# Altium schematic sheet RK3568-Flash-SD-Controller.SchDoc
size 420 x 297 mm; SheetNumber: 7; SheetTotal: 25
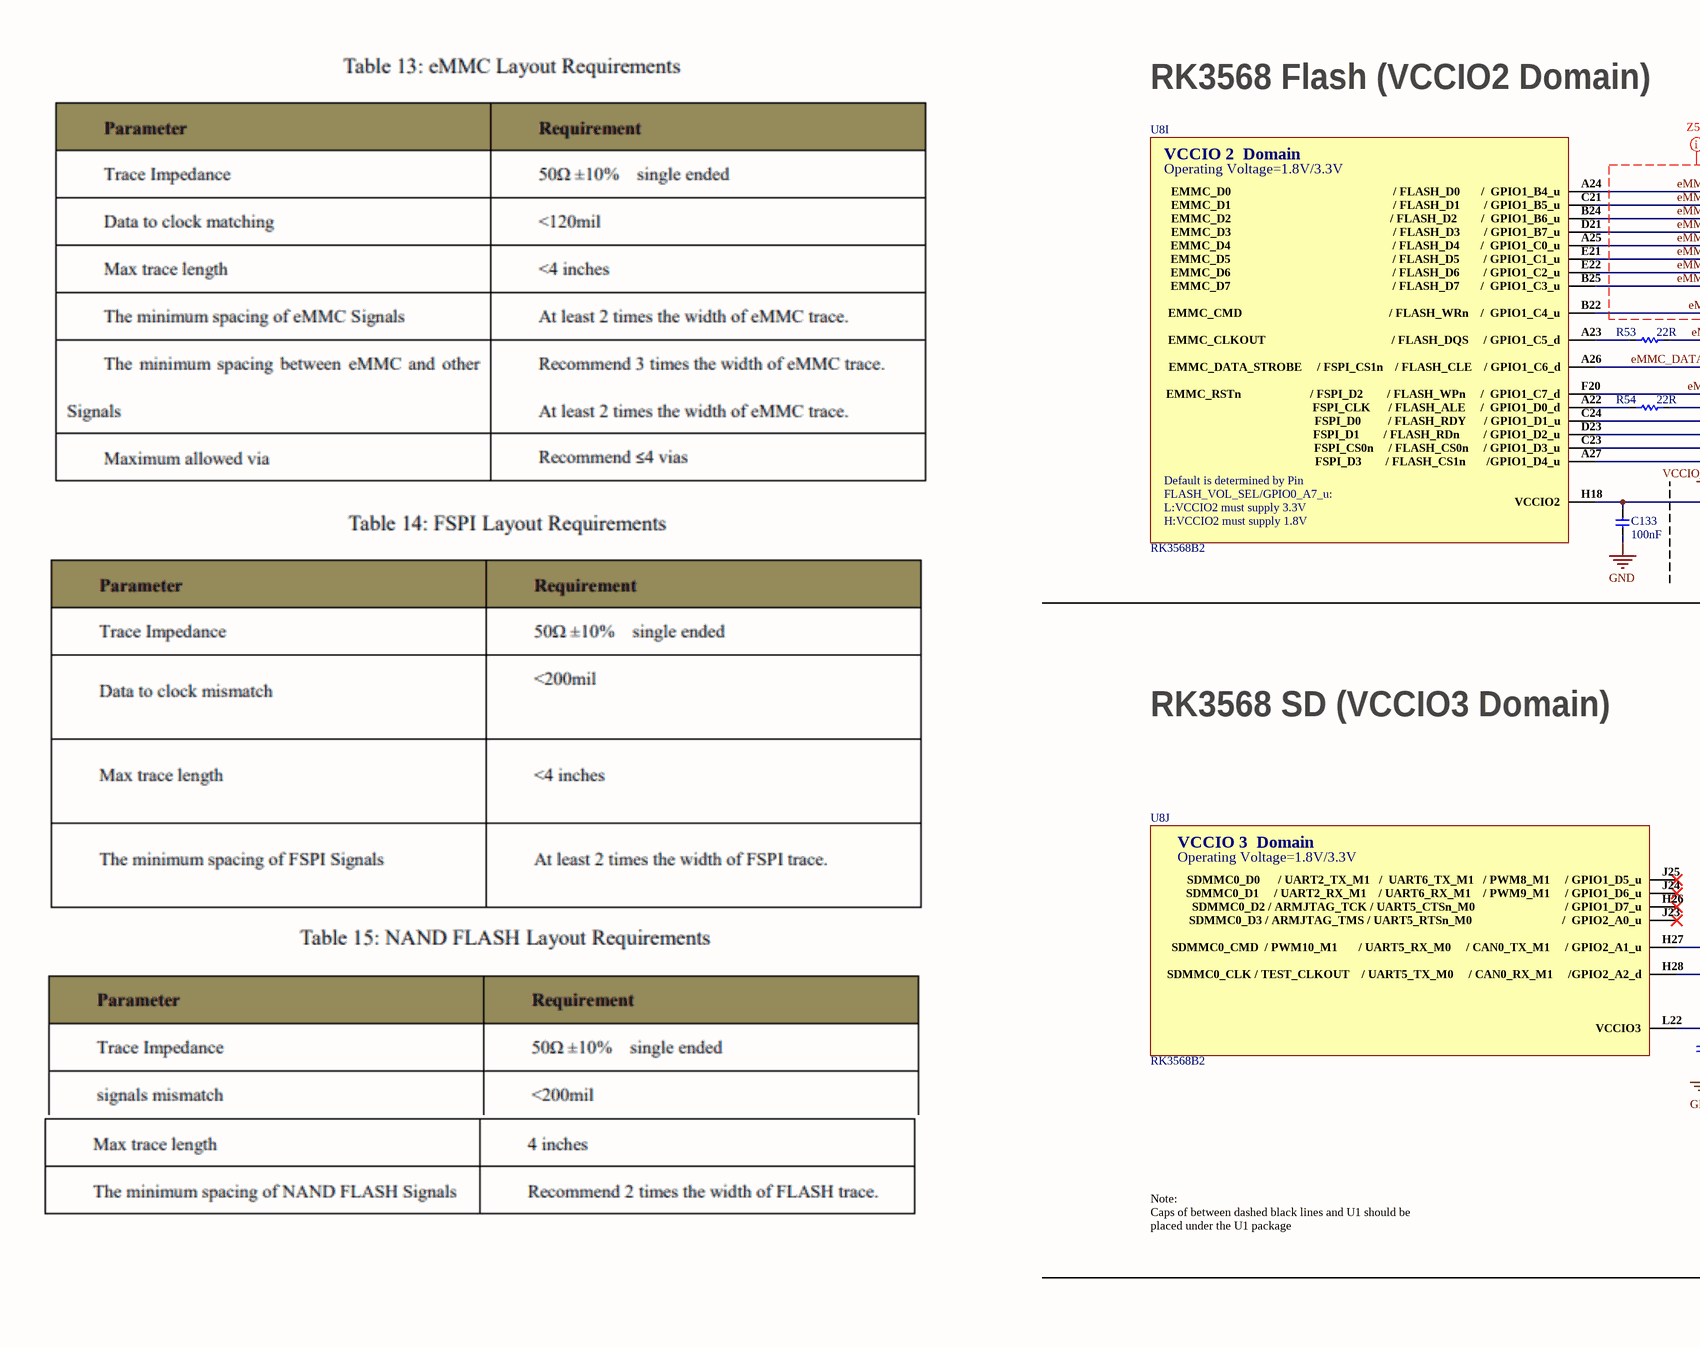
[diagram p0: RK3568-Flash-SD-Controller.SchDoc, left]
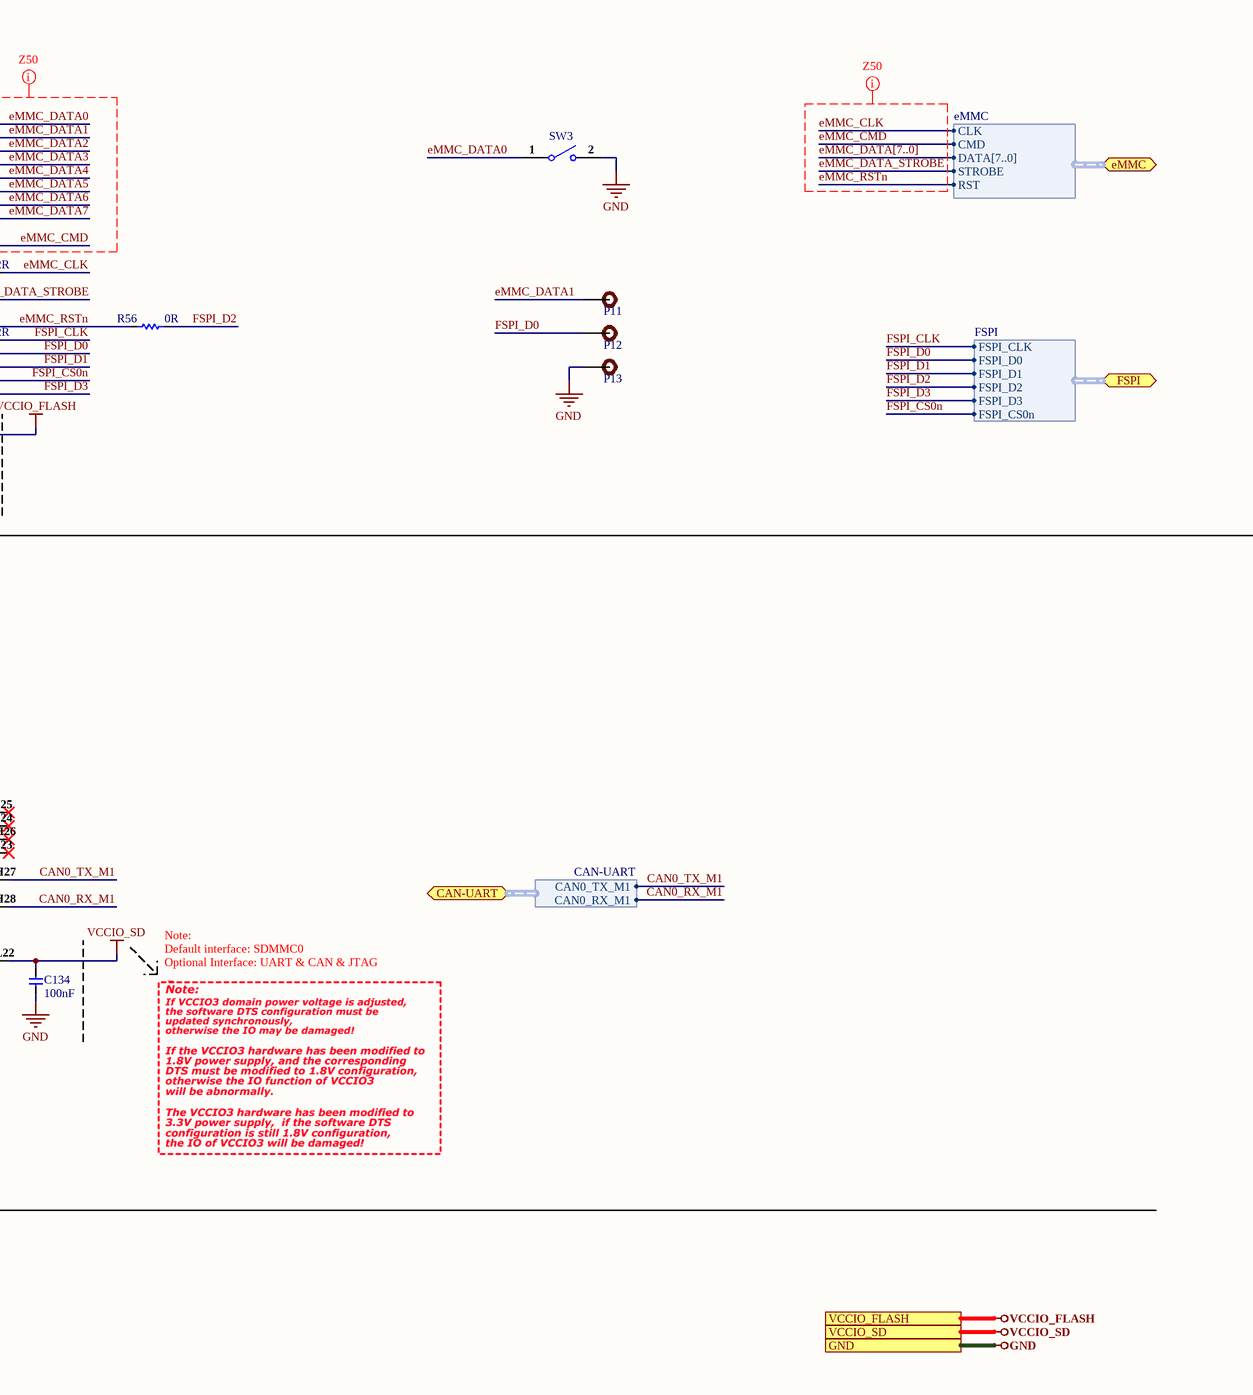
[diagram p1: RK3568-Flash-SD-Controller.SchDoc, right]

## Parts
C133  100nF  [CAP-0201]
C134  100nF  [CAP-0201]
P11  TEST POINT 0.5mm Dia  [Test-point - 0.5mm]  (value not drawn)  (no BOM)
P12  TEST POINT 0.5mm Dia  [Test-point - 0.5mm]  (value not drawn)  (no BOM)
P13  TEST POINT 0.5mm Dia  [Test-point - 0.5mm]  (value not drawn)  (no BOM)
R53  22R  [Res-0402]
R54  22R  [Res-0402]
R56  0R  [Res-0402]
SW3  B3U-1000P  [B3U-1000P]  (value not drawn)
U8  RK3568B2  [FCCSP-636L]  (parts I,J of 23)

## Ports
CAN-UART (bidir, harness CAN-UART, see CAN-Bus-SPI-Flash-Sheet[1D]), eMMC (bidir, harness eMMC, see eMMC-Sheet[2D]), FSPI (bidir, harness FSPI, see CAN-Bus-SPI-Flash-Sheet[3D]), GND (see CAN-Bus-SPI-Flash-Sheet[4D], Connector-Sheet[5D], DRAM-LPDDR4x-Sheet[4D], eMMC-Sheet[4D], LED-Debug-Sheet[4D], Power-DC-IN-Sheet[4D], Power-Others-Sheet[4D], Power-PMIC-Sheet[4D], RK3568-Audio-Interface[4D], RK3568-OSC-PMUIO-Sheet[5D], RK3568-Power-Sheet[4D], RK3568-SARADC-GPIO[4D], RK3568-USB-PCIe-Sheet[5D], RK3568-VI-Interface-Sheet[4D], RK3568-VO-Interface-1[4D], RK3568-VO-Interface-2[4D], Sensors-Sheet-1[4D], Sensors-Sheet-2[5D], Type-C-Sheet[4D], USB-Ports[4D], VO-HDMI2.0-TX-Sheet[4D], VO-LCM-MIPI-DSI-TX0[4D], WIFI-BT-SDIO-Sheet[4D]), VCCIO_FLASH (see CAN-Bus-SPI-Flash-Sheet[4D], eMMC-Sheet[4D], Power-Others-Sheet[4D]), VCCIO_SD (see Power-PMIC-Sheet[3D])

## Harnesses
eMMC: DATA[7..0], STROBE, CLK, CMD, RST
FSPI: FSPI_D2, FSPI_CLK, FSPI_D0, FSPI_D1, FSPI_CS0n, FSPI_D3
CAN-UART: CAN0_TX_M1, CAN0_RX_M1

## Nets
GND: C133.1 C134.1 P13.1 SW3.2 ; port GND
VCCIO_FLASH: C133.2 U8.H18(VCCIO2) ; port VCCIO_FLASH
VCCIO_SD: C134.2 U8.L22(VCCIO3) ; port VCCIO_SD
CAN0_RX_M1: U8.H28(SDMMC0_CLK_/_TEST_CLKOUT____/_UART5_TX_M0_____/_CAN0_RX_M1_____/GPIO2_A2_d) ; port CAN-UART.CAN0_RX_M1
CAN0_TX_M1: U8.H27(SDMMC0_CMD__/_PWM10_M1_______/_UART5_RX_M0_____/_CAN0_TX_M1_____/_GPIO2_A1_u) ; port CAN-UART.CAN0_TX_M1
eMMC_CLK: R53.1 ; port eMMC.CLK
eMMC_CMD: U8.B22(EMMC_CMD_________________________________________________/_FLASH_WRn____/__GPIO1_C4_u) ; port eMMC.CMD
eMMC_DATA0: SW3.1 U8.A24(EMMC_D0______________________________________________________/_FLASH_D0_______/__GPIO1_B4_u)
eMMC_DATA1: P11.1 U8.C21(EMMC_D1______________________________________________________/_FLASH_D1________/_GPIO1_B5_u)
eMMC_DATA2: U8.B24(EMMC_D2_____________________________________________________/_FLASH_D2________/__GPIO1_B6_u)
eMMC_DATA3: U8.D21(EMMC_D3______________________________________________________/_FLASH_D3________/_GPIO1_B7_u)
eMMC_DATA4: U8.A25(EMMC_D4______________________________________________________/_FLASH_D4_______/__GPIO1_C0_u)
eMMC_DATA5: U8.E21(EMMC_D5______________________________________________________/_FLASH_D5________/_GPIO1_C1_u)
eMMC_DATA6: U8.E22(EMMC_D6______________________________________________________/_FLASH_D6________/_GPIO1_C2_u)
eMMC_DATA7: U8.B25(EMMC_D7______________________________________________________/_FLASH_D7_______/__GPIO1_C3_u)
eMMC_DATA_STROBE: U8.A26(EMMC_DATA_STROBE_____/_FSPI_CS1n____/_FLASH_CLE____/_GPIO1_C6_d) ; port eMMC.STROBE
eMMC_RSTn: R56.1 U8.F20(EMMC_RSTn_______________________/_FSPI_D2________/_FLASH_WPn_____/__GPIO1_C7_d) ; port eMMC.RST
FSPI_CLK: R54.1 ; port FSPI.FSPI_CLK
FSPI_CS0n: U8.C23(FSPI_CS0n_____/_FLASH_CS0n_____/_GPIO1_D3_u) ; port FSPI.FSPI_CS0n
FSPI_D0: P12.1 U8.C24(FSPI_D0_________/_FLASH_RDY______/_GPIO1_D1_u) ; port FSPI.FSPI_D0
FSPI_D1: U8.D23(FSPI_D1________/_FLASH_RDn________/_GPIO1_D2_u) ; port FSPI.FSPI_D1
FSPI_D2: R56.2 ; port FSPI.FSPI_D2
FSPI_D3: U8.A27(FSPI_D3________/_FLASH_CS1n_______/GPIO1_D4_u) ; port FSPI.FSPI_D3
NetR53_2: R53.2 U8.A23(EMMC_CLKOUT__________________________________________/_FLASH_DQS_____/_GPIO1_C5_d)
NetR54_2: R54.2 U8.A22(FSPI_CLK______/_FLASH_ALE_____/__GPIO1_D0_d)

Not connected (* = marked no-connect by the designer): U8 H26(SDMMC0_D2_/_ARMJTAG_TCK_/_UART5_CTSn_M0______________________________/_GPIO1_D7_u)* J23(SDMMC0_D3_/_ARMJTAG_TMS_/_UART5_RTSn_M0______________________________/__GPIO2_A0_u)* J24(SDMMC0_D1_____/_UART2_RX_M1____/_UART6_RX_M1____/_PWM9_M1_____/_GPIO1_D6_u)* J25(SDMMC0_D0______/_UART2_TX_M1___/__UART6_TX_M1___/_PWM8_M1_____/_GPIO1_D5_u)*

## Buses and harness runs
bus eMMC_DATA[7..0]

## Layout directives
net class 50OHM_DDR: eMMC_CLK, eMMC_CMD, eMMC_DATA0, eMMC_DATA1, eMMC_DATA2, eMMC_DATA3, eMMC_DATA4, eMMC_DATA5, eMMC_DATA6, eMMC_DATA7, eMMC_DATA[7..0], eMMC_DATA_STROBE, eMMC_RSTn

## Notes on the sheet
- RK3568 Flash (VCCIO2 Domain)
- RK3568 SD (VCCIO3 Domain)
- Note:
  Default interface: SDMMC0
  Optional Interface: UART & CAN & JTAG
- Note:
  Caps of between dashed black lines and U1 should be placed under the U1 package
- File:
- Title:
- Date:
- Page
- Num:
- Total:
- Drawn By: Huzaifa Ali
- (in symbol RK3568B2, part I) VCCIO 2  Domain; Operating Voltage=1.8V/3.3V; Default is determined by Pin; FLASH_VOL_SEL/GPIO0_A7_u:; L:VCCIO2 must supply 3.3V; H:VCCIO2 must supply 1.8V
- (in symbol RK3568B2, part J) VCCIO 3  Domain; Operating Voltage=1.8V/3.3V

## Library data of the parts
C133 C134 = CC0201KRX5R6BB104: CAP CER 0.1UF 10V X5R 0201; Manufacturer: Yageo; Tolerance: 10%; Supplier 1: Mouser; Manufacturer Part Number: CC0201KRX5R6BB104; RoHS: Yes; Category: Ceramic Capacitors; Stock 1: 824403; Pricing 1: 1=0.10000, 10=0.02400, 50=0.02400, 100=0.01900, 1000=0.01100, 10000=0.00900 (USD); Mount: Surface Mount; Case/Package: 0201; Case Code (Imperial): 0201; Case Code (Metric): 0603; Weight: 6E-06oz; Min Operating Temperature: -55°C; Max Operating Temperature: 85°C; Capacitance: 100nF; Dielectric: X5R; Voltage Rating (DC): 10V; Packaging: Tape and Reel; Termination: SMD/SMT; Resistor Type: Ceramic; Voltage Rating: 10V; Series: CC; Construction: Flat; Length: 0.6mm; Width: 0.012inch; Height: 0.3mm; Thickness: 0.013inch; Depth: 0.3mm; Radiation Hardening: No; Lead Free: Lead Free; Halogen Free: Halogen Free; RoHS Compliant: Yes; ComponentLink1URL: https://datasheet.ciiva.com/11587/upy-gphc-x5r-4v-to-50v-12-11587190.pdf?src-supplier=Avnet; ComponentLink1Description: https://datasheet.ciiva.com/11587/upy-gphc-x5r-4v-to-50v-12-11587190.pdf?src-supplier=Avnet; Supplier Part Number 1: 603-CC201KRX5R6BB104; LCSC Part Number: C190183
P11-P13 = TEST POINT 0.5mm Dia: Test Point ON; Item Type: Test Point; Manufacturer Part Number: TEST POINT 0.5mm Dia
R53 R54 = RC0402FR-0722RL: RES 22 OHM 1% 1/16W 0402; Manufacturer: Yageo; Voltage Rating: 50V; Power Rating: 62.5mW; Temperature Coefficient: 100ppm/°C; Max Power Dissipation: 63mW; Item Type: Resistor; Supplier 1: Avnet; Manufacturer Part Number: RC0402FR-0722RL; RoHS: Yes; Category: Chip SMD Resistors; Stock 1: 1810000; Pricing 1: 10000=0.00085 (USD); Case/Package: 0402; Number of Pins: 2; Case Code (Imperial): 0402; Case Code (Metric): 1005; Size Code: 0402; Min Operating Temperature: -55°C; Max Operating Temperature: 155°C; Resistor Type: Thick Film; Voltage Rating (DC): 50V; Resistance: 22R; Tolerance: 1%; Packaging: Tape and Reel; Termination: SMD/SMT; Features: Moisture Resistant; Series: RC; Number of Terminations: 2; Resistance Tolerance: 1%; Technology: THICK FILM; Construction: Rectangular; Length: 1mm; Width: 0.5mm; Height: 0.32mm; Depth: 0.5mm; RoHS Compliant: Yes; Reach SVHC Compliant: Yes; Military Standard: Not; Lead Free: Lead Free; ComponentLink1URL: https://datasheet.ciiva.com/11819/0900766b80c66297-11819462.pdf?src-supplier=RSComponents; ComponentLink1Description: https://datasheet.ciiva.com/11819/0900766b80c66297-11819462.pdf?src-supplier=RSComponents; ComponentLink2URL: https://datasheet.ciiva.com/7849/1018594-7849912.pdf?src-supplier=Element14; ComponentLink2Description: https://datasheet.ciiva.com/7849/1018594-7849912.pdf?src-supplier=Element14; ComponentLink3URL: https://datasheet.ciiva.com/7849/1018594-7849911.pdf?src-supplier=Element14; ComponentLink3Description: https://datasheet.ciiva.com/7849/1018594-7849911.pdf?src-supplier=Element14; ComponentLink4URL: https://datasheet.ciiva.com/16930/pyu-rc0402-51-rohs-l-6-r-16930687.pdf?src-supplier=Future+Electronics; ComponentLink4Description: https://datasheet.ciiva.com/16930/pyu-rc0402-51-rohs-l-6-r-16930687.pdf?src-supplier=Future+Electronics; ComponentLink5URL: https://datasheet.ciiva.com/26829/getdatasheetpartid-554995-26829991.pdf?src-supplier=Verical; ComponentLink5Description: https://datasheet.ciiva.com/26829/getdatasheetpartid-554995-26829991.pdf?src-supplier=Verical; Supplier Part Number 1: RC0402FR-0722RL; LCSC Part Number: C114765
R56 = RC0402FR-070RL: RES 0 OHM JUMPER 1/16W 0402; Manufacturer: Yageo; Tolerance: 1%; Power Rating: 62.5mW; Voltage Rating: 50V; Temperature Coefficient: 200ppm/°C; Max Power Dissipation: 63mW; Supplier 1: Mouser; Manufacturer Part Number: RC0402FR-070RL; RoHS: Yes; Category: Chip SMD Resistors; Stock 1: 8556842; Pricing 1: 1=0.10000, 10=0.01400, 50=0.01400, 100=0.00600, 1000=0.00300, 5000=0.00200, 10000=0.00100 (USD); Mount: Surface Mount; Case/Package: 0402; Contact Plating: Tin,Matte; Case Code (Imperial): 0402; Case Code (Metric): 1005; Size Code: 0402; Min Operating Temperature: -55°C; Max Operating Temperature: 155°C; Resistance: 0R; Resistor Type: Thick Film; Packaging: Tape and Reel; Termination: SMD/SMT; Features: Moisture Resistant; Series: RC; Number of Terminations: 2; Length: 1mm; Width: 0.5mm; Height: 0.35mm; Radiation Hardening: No; Lead Free: Lead Free; RoHS Compliant: Yes; ComponentLink1URL: https://datasheet.ciiva.com/8896/pyu-rc0402-51-rohs-l-6-8896149.pdf?src-supplier=Avnet; ComponentLink1Description: https://datasheet.ciiva.com/8896/pyu-rc0402-51-rohs-l-6-8896149.pdf?src-supplier=Avnet; ComponentLink2URL: https://datasheet.ciiva.com/16790/pyu-rc0402-51-rohs-l-6-r-16790444.pdf?src-supplier=Future+Electronics; ComponentLink2Description: https://datasheet.ciiva.com/16790/pyu-rc0402-51-rohs-l-6-r-16790444.pdf?src-supplier=Future+Electronics; Supplier Part Number 1: 603-RC0402FR-070RL; LCSC Part Number: C106231
SW3 = B3U-1000P: SWITCH TACTILE SPST-NO 0.05A 12V; Manufacturer: Omron; Mechanical Life: 200000Cycles; Operating Force: 1.5N; Throw Configuration: SPST; Current Rating: 50mA; Contact Resistance: 100mR; Illumination Type: Non-Illuminated,Illuminated; Switch Travel: 0.15mm; Switch Function: Off-Mom; Actuator Type: Standard; Actuator Length: 0.4mm; Ratings: Dust Proof,IP40; ComponentLink1URL: http://www.farnell.com/datasheets/60838.pdf?src-supplier=Farnell; ComponentLink1Description: http://www.farnell.com/datasheets/60838.pdf?src-supplier=Farnell; ComponentLink2URL: http://www.farnell.com/datasheets/60838.pdf?src-supplier=Element14; ComponentLink2Description: http://www.farnell.com/datasheets/60838.pdf?src-supplier=Element14; ComponentLink3URL: https://omronfs.omron.com/en_US/ecb/products/pdf/en-b3u.pdf?src-supplier=Digi-Key; ComponentLink3Description: https://omronfs.omron.com/en_US/ecb/products/pdf/en-b3u.pdf?src-supplier=Digi-Key; ComponentLink4URL: http://www.omron.com/ecb/products/pdf/en-b3u.pdf?src-supplier=Digi-Key; ComponentLink4Description: http://www.omron.com/ecb/products/pdf/en-b3u.pdf?src-supplier=Digi-Key; ComponentLink5URL: https://www.distrelec.biz/Web/Downloads/he/et/B3U_eng_datasheet.pdf?mime=application%2Fpdf&src-supplier=Distrelec; ComponentLink5Description: https://www.distrelec.biz/Web/Downloads/he/et/B3U_eng_datasheet.pdf?mime=application%2Fpdf&src-supplier=Distrelec; ComponentLink6URL: http://www.onlinecomponents.com/productFiles/mf-OM/en-b3u.pdf?src-supplier=Onlinecomponents.com; ComponentLink6Description: http://www.onlinecomponents.com/productFiles/mf-OM/en-b3u.pdf?src-supplier=Onlinecomponents.com; Supplier 1: Digi-Key; Manufacturer Part Number: B3U-1000P; Stock 1: 116454; Pricing 1: 1=1, 10=0.961, 25=0.9064, 50=0.7976, 100=0.7251, 250=0.68888, 500=0.67074, 1000=0.52571 (USD); Mount: Surface Mount; Weight: 0.000776oz; Contact Material: Silver; Min Operating Temperature: -25°C; Max Operating Temperature: 70°C; Packaging: Tape and Reel; Voltage Rating (DC): 12V; Package Quantity: 1; Max Current Rating: 50mA; Termination: SMD/SMT; Orientation: Straight; Max Voltage Rating (DC): 12V; Electrical Life: 200000Cycles; Insulation Resistance: 100MR; Contact Current Rating: 50mA; Length: 4mm; Height: 1.2mm; Depth: 2.5mm; Width: 3mm; REACH SVHC: Unknown; Lead Free: Lead Free; ComponentLink7URL: https://www.verical.com/server-webapp/html/getDatasheet?partID=552554&src-supplier=Verical; ComponentLink7Description: https://www.verical.com/server-webapp/html/getDatasheet?partID=552554&src-supplier=Verical; ComponentLink8URL: http://www.farnell.com/datasheets/1685550.pdf?src-supplier=Element14; ComponentLink8Description: http://www.farnell.com/datasheets/1685550.pdf?src-supplier=Element14; ComponentLink9URL: http://www.farnell.com/datasheets/2610940.pdf?src-supplier=Farnell; ComponentLink9Description: http://www.farnell.com/datasheets/2610940.pdf?src-supplier=Farnell; ComponentLink10URL: https://www.alliedelec.com/m/d/4c8a9ef82804fc3c241a13c1e298fd73.pdf?src-supplier=Allied+Electronics; ComponentLink10Description: https://www.alliedelec.com/m/d/4c8a9ef82804fc3c241a13c1e298fd73.pdf?src-supplier=Allied+Electronics; Supplier Part Number 1: SW1020DKR-ND; LCSC Part Number: C231329; Item Type: Switch
U8 = RK3568B2: FCCSP-636L Microcontroller Units (MCUs/MPUs/SOCs) ROHS; Manufacturer: Rockchip; Item Type: IC; Manufacturer Part Number: RK3568B2; Package: FCCSP-636L; LCSC Part Number: C3345225